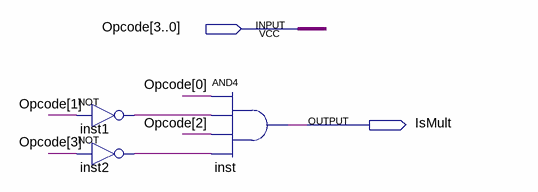
[diagram p0: schematic sheet]
// Quartus schematic IsMult.bdf as structural Verilog: 3 symbols, 2 pins
module IsMult (
  input  [3:0] Opcode,
  output IsMult
);

  wire inst1_out, inst2_out;

  not inst1 (inst1_out, Opcode[1]);
  not inst2 (inst2_out, Opcode[3]);
  and inst (IsMult, Opcode[0], inst1_out, Opcode[2], inst2_out);
endmodule
